# Altium schematic sheet Power4HiSpeed.SchDoc
size A3; Organization: Altium Limited; Address1: L3, 12a Rodborough Rd; Address2: Frenchs Forest; Address3: NSW; Address4: Australia 2086
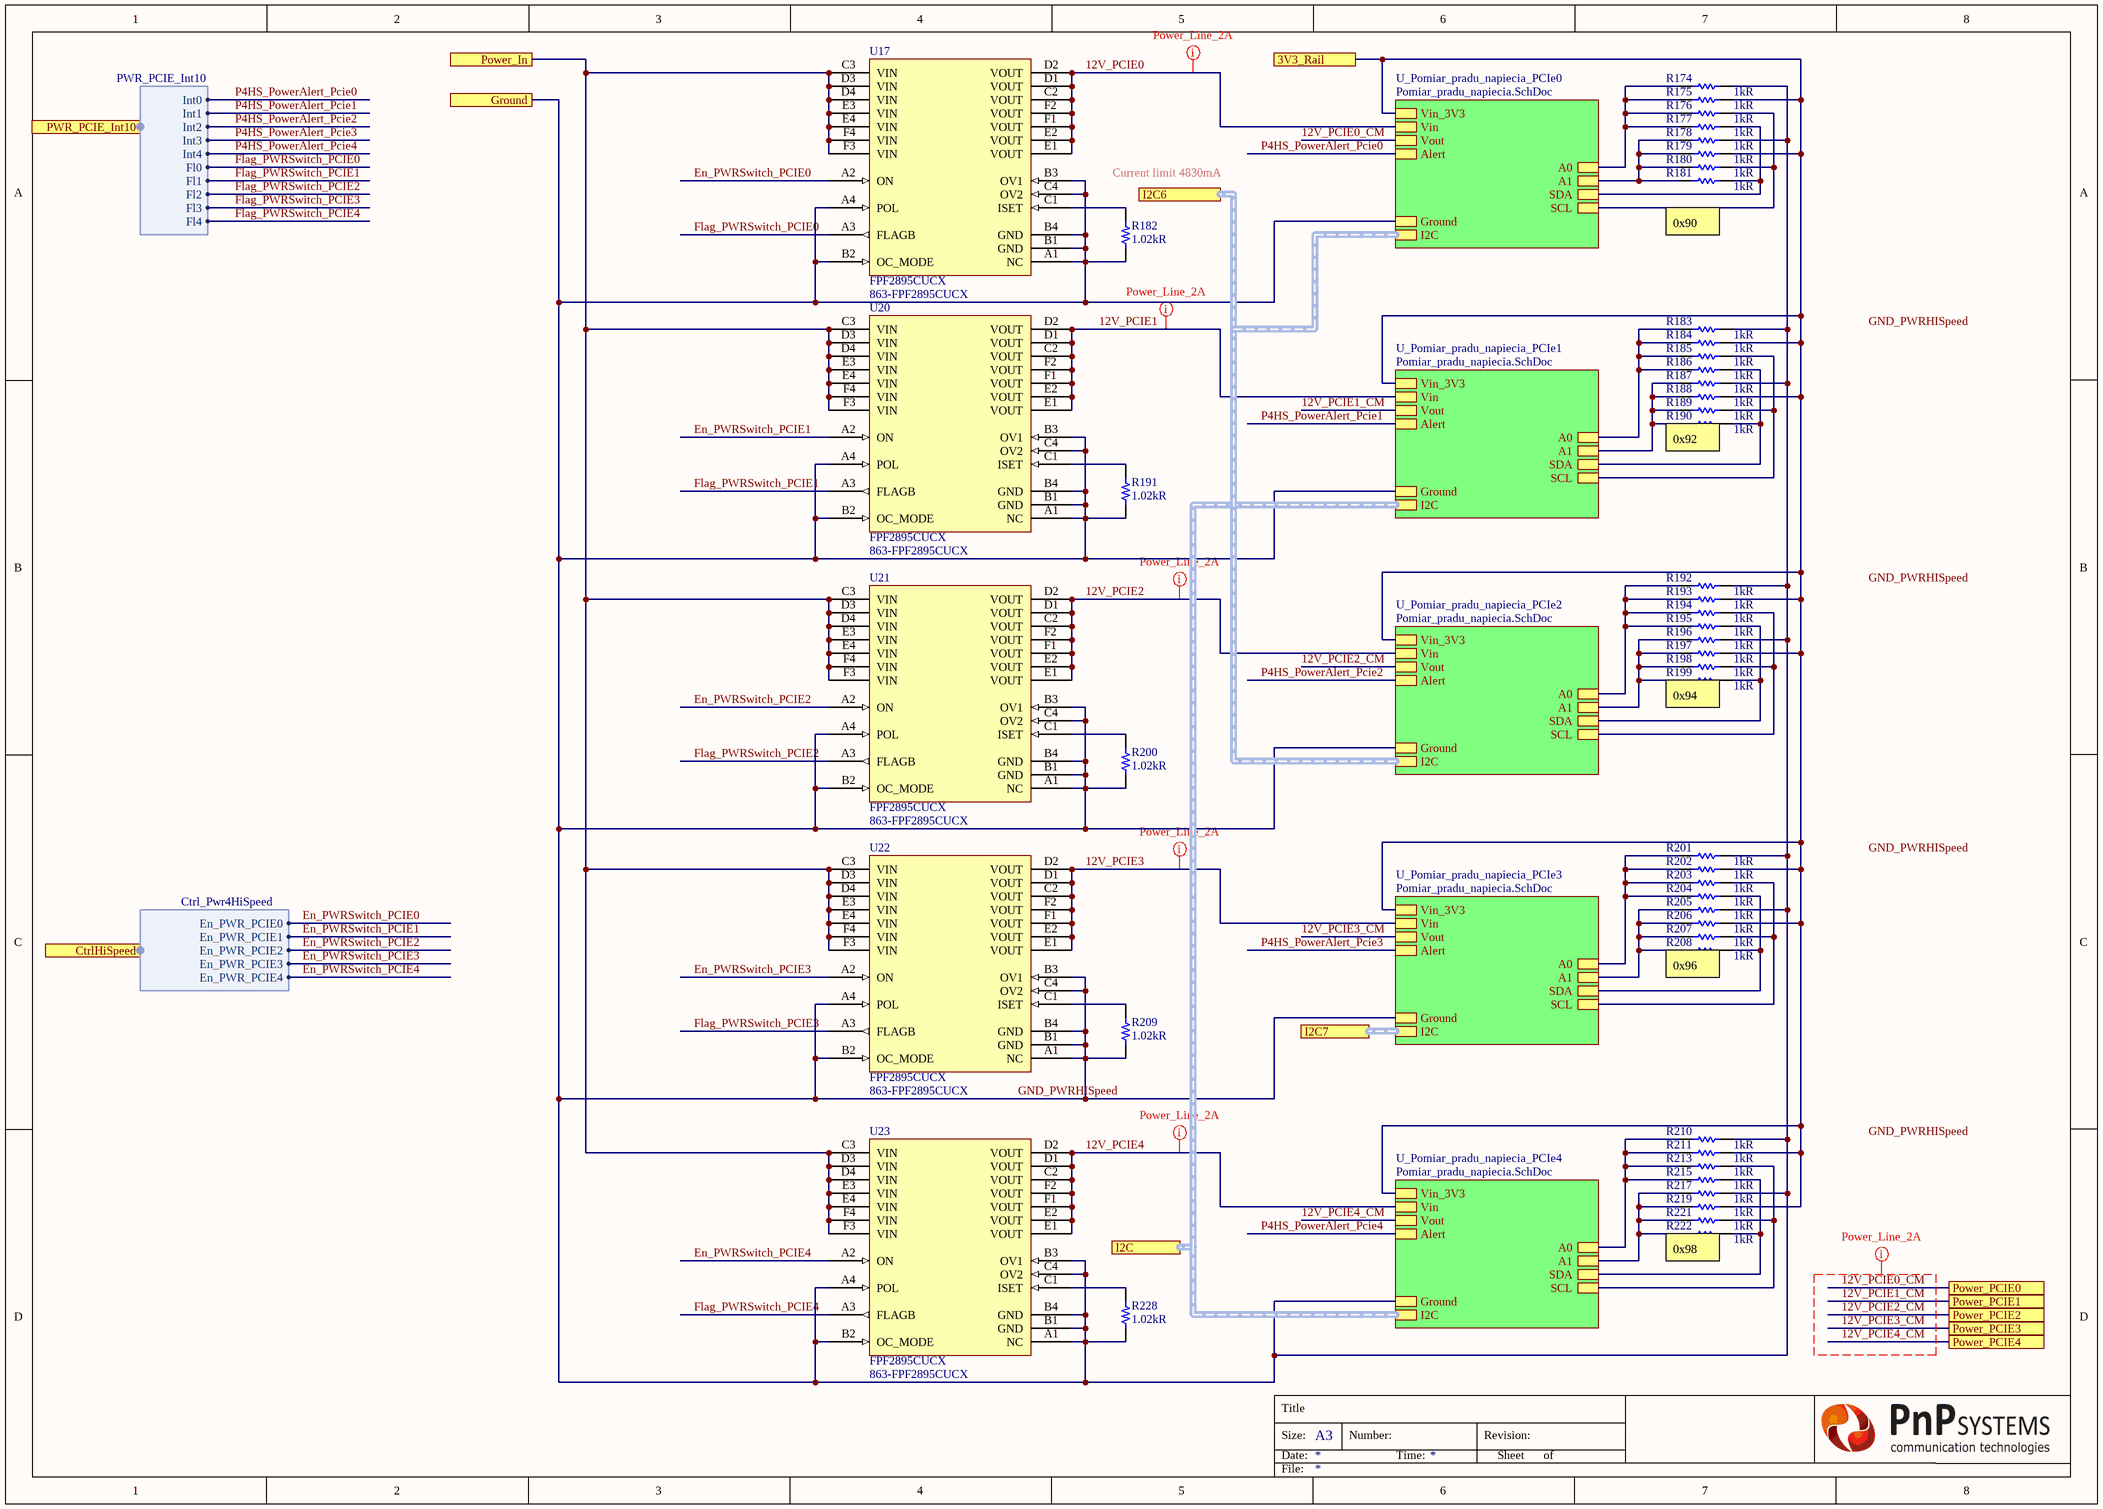
[diagram p0: Power4HiSpeed.SchDoc]

## Parts
R174  1kR  [RES 0402/1005 RF KK]
R175  1kR  [RES 0402/1005 RF KK]
R176  1kR  [RES 0402/1005 RF KK]
R177  1kR  [RES 0402/1005 RF KK]
R178  1kR  [RES 0402/1005 RF KK]
R179  1kR  [RES 0402/1005 RF KK]
R180  1kR  [RES 0402/1005 RF KK]
R181  1kR  [RES 0402/1005 RF KK]
R182  1.02kR  [RES 0402/1005 RF KK]
R183  1kR  [RES 0402/1005 RF KK]
R184  1kR  [RES 0402/1005 RF KK]
R185  1kR  [RES 0402/1005 RF KK]
R186  1kR  [RES 0402/1005 RF KK]
R187  1kR  [RES 0402/1005 RF KK]
R188  1kR  [RES 0402/1005 RF KK]
R189  1kR  [RES 0402/1005 RF KK]
R190  1kR  [RES 0402/1005 RF KK]
R191  1.02kR  [RES 0402/1005 RF KK]
R192  1kR  [RES 0402/1005 RF KK]
R193  1kR  [RES 0402/1005 RF KK]
R194  1kR  [RES 0402/1005 RF KK]
R195  1kR  [RES 0402/1005 RF KK]
R196  1kR  [RES 0402/1005 RF KK]
R197  1kR  [RES 0402/1005 RF KK]
R198  1kR  [RES 0402/1005 RF KK]
R199  1kR  [RES 0402/1005 RF KK]
R200  1.02kR  [RES 0402/1005 RF KK]
R201  1kR  [RES 0402/1005 RF KK]
R202  1kR  [RES 0402/1005 RF KK]
R203  1kR  [RES 0402/1005 RF KK]
R204  1kR  [RES 0402/1005 RF KK]
R205  1kR  [RES 0402/1005 RF KK]
R206  1kR  [RES 0402/1005 RF KK]
R207  1kR  [RES 0402/1005 RF KK]
R208  1kR  [RES 0402/1005 RF KK]
R209  1.02kR  [RES 0402/1005 RF KK]
R210  1kR  [RES 0402/1005 RF KK]
R211  1kR  [RES 0402/1005 RF KK]
R213  1kR  [RES 0402/1005 RF KK]
R215  1kR  [RES 0402/1005 RF KK]
R217  1kR  [RES 0402/1005 RF KK]
R219  1kR  [RES 0402/1005 RF KK]
R221  1kR  [RES 0402/1005 RF KK]
R222  1kR  [RES 0402/1005 RF KK]
R228  1.02kR  [RES 0402/1005 RF KK]
U17  FPF2895CUCX  Supplier Part Number 1: 863-FPF2895CUCX  [FPF2895C-D]
U20  FPF2895CUCX  Supplier Part Number 1: 863-FPF2895CUCX  [FPF2895C-D]
U21  FPF2895CUCX  Supplier Part Number 1: 863-FPF2895CUCX  [FPF2895C-D]
U22  FPF2895CUCX  Supplier Part Number 1: 863-FPF2895CUCX  [FPF2895C-D]
U23  FPF2895CUCX  Supplier Part Number 1: 863-FPF2895CUCX  [FPF2895C-D]

## Sub-sheets
U_Pomiar_pradu_napiecia_PCIe0 = Pomiar_pradu_napiecia.SchDoc: Vin_3V3, Vin, Vout, Alert, A0, A1, SDA, SCL, Ground, I2C (harness I2C)
U_Pomiar_pradu_napiecia_PCIe1 = Pomiar_pradu_napiecia.SchDoc: Vin_3V3, Vin, Vout, Alert, A0, A1, SDA, SCL, Ground, I2C (harness I2C)
U_Pomiar_pradu_napiecia_PCIe2 = Pomiar_pradu_napiecia.SchDoc: Vin_3V3, Vin, Vout, Alert, A0, A1, SDA, SCL, Ground, I2C (harness I2C)
U_Pomiar_pradu_napiecia_PCIe3 = Pomiar_pradu_napiecia.SchDoc: Vin_3V3, Vin, Vout, Alert, A0, A1, SDA, SCL, Ground, I2C (harness I2C)
U_Pomiar_pradu_napiecia_PCIe4 = Pomiar_pradu_napiecia.SchDoc: Vin_3V3, Vin, Vout, Alert, A0, A1, SDA, SCL, Ground, I2C (harness I2C)

## Ports
3V3_Rail, CtrlHiSpeed (harness Ctrl_Pwr4HiSpeed), Ground, I2C6, I2C7, I2C (harness I2C), Power_In, Power_PCIE0, Power_PCIE1, Power_PCIE2, Power_PCIE3, Power_PCIE4, PWR_PCIE_Int10 (harness PWR_PCIE_Int10)

## Harnesses
Ctrl_Pwr4HiSpeed: En_PWR_PCIE0, En_PWR_PCIE1, En_PWR_PCIE2, En_PWR_PCIE3, En_PWR_PCIE4
PWR_PCIE_Int10: Int0, Int1, Int2, Int3, Int4, Fl0, Fl1, Fl2, Fl3, Fl4

## Nets
3V3_Rail: R175.2 R179.2 R184.2 R188.2 R193.2 R197.2 R202.2 R206.2 R211.2 R219.2 ; port 3V3_Rail, sheet U_Pomiar_pradu_napiecia_PCIe0/Vin_3V3, sheet U_Pomiar_pradu_napiecia_PCIe1/Vin_3V3, sheet U_Pomiar_pradu_napiecia_PCIe2/Vin_3V3, sheet U_Pomiar_pradu_napiecia_PCIe3/Vin_3V3, sheet U_Pomiar_pradu_napiecia_PCIe4/Vin_3V3
12V_PCIE0: U17.C2(VOUT) U17.D1(VOUT) U17.D2(VOUT) U17.E1(VOUT) U17.E2(VOUT) U17.F1(VOUT) U17.F2(VOUT) ; sheet U_Pomiar_pradu_napiecia_PCIe0/Vin
12V_PCIE0_CM: port Power_PCIE0, sheet U_Pomiar_pradu_napiecia_PCIe0/Vout
12V_PCIE1: U20.C2(VOUT) U20.D1(VOUT) U20.D2(VOUT) U20.E1(VOUT) U20.E2(VOUT) U20.F1(VOUT) U20.F2(VOUT) ; sheet U_Pomiar_pradu_napiecia_PCIe1/Vin
12V_PCIE1_CM: port Power_PCIE1, sheet U_Pomiar_pradu_napiecia_PCIe1/Vout
12V_PCIE2: U21.C2(VOUT) U21.D1(VOUT) U21.D2(VOUT) U21.E1(VOUT) U21.E2(VOUT) U21.F1(VOUT) U21.F2(VOUT) ; sheet U_Pomiar_pradu_napiecia_PCIe2/Vin
12V_PCIE2_CM: port Power_PCIE2, sheet U_Pomiar_pradu_napiecia_PCIe2/Vout
12V_PCIE3: U22.C2(VOUT) U22.D1(VOUT) U22.D2(VOUT) U22.E1(VOUT) U22.E2(VOUT) U22.F1(VOUT) U22.F2(VOUT) ; sheet U_Pomiar_pradu_napiecia_PCIe3/Vin
12V_PCIE3_CM: port Power_PCIE3, sheet U_Pomiar_pradu_napiecia_PCIe3/Vout
12V_PCIE4: U23.C2(VOUT) U23.D1(VOUT) U23.D2(VOUT) U23.E1(VOUT) U23.E2(VOUT) U23.F1(VOUT) U23.F2(VOUT) ; sheet U_Pomiar_pradu_napiecia_PCIe4/Vin
12V_PCIE4_CM: port Power_PCIE4, sheet U_Pomiar_pradu_napiecia_PCIe4/Vout
En_PWRSwitch_PCIE0: U17.A2(ON) ; port CtrlHiSpeed.En_PWR_PCIE0
En_PWRSwitch_PCIE1: U20.A2(ON) ; port CtrlHiSpeed.En_PWR_PCIE1
En_PWRSwitch_PCIE2: U21.A2(ON) ; port CtrlHiSpeed.En_PWR_PCIE2
En_PWRSwitch_PCIE3: U22.A2(ON) ; port CtrlHiSpeed.En_PWR_PCIE3
En_PWRSwitch_PCIE4: U23.A2(ON) ; port CtrlHiSpeed.En_PWR_PCIE4
Flag_PWRSwitch_PCIE0: U17.A3(FLAGB) ; port PWR_PCIE_Int10.Fl0
Flag_PWRSwitch_PCIE1: U20.A3(FLAGB) ; port PWR_PCIE_Int10.Fl1
Flag_PWRSwitch_PCIE2: U21.A3(FLAGB) ; port PWR_PCIE_Int10.Fl2
Flag_PWRSwitch_PCIE3: U22.A3(FLAGB) ; port PWR_PCIE_Int10.Fl3
Flag_PWRSwitch_PCIE4: U23.A3(FLAGB) ; port PWR_PCIE_Int10.Fl4
GND_PWRHISpeed: R174.2 R178.2 R182.1 R183.2 R187.2 R191.1 R192.2 R196.2 R200.1 R201.2 R205.2 R209.1 R210.2 R217.2 R228.1 U17.A1(NC) U17.A4(POL) U17.B1(GND) U17.B2(OC_MODE) U17.B3(OV1) U17.B4(GND) U17.C4(OV2) U20.A1(NC) U20.A4(POL) U20.B1(GND) U20.B2(OC_MODE) U20.B3(OV1) U20.B4(GND) U20.C4(OV2) U21.A1(NC) U21.A4(POL) U21.B1(GND) U21.B2(OC_MODE) U21.B3(OV1) U21.B4(GND) U21.C4(OV2) U22.A1(NC) U22.A4(POL) U22.B1(GND) U22.B2(OC_MODE) U22.B3(OV1) U22.B4(GND) U22.C4(OV2) U23.A1(NC) U23.A4(POL) U23.B1(GND) U23.B2(OC_MODE) U23.B3(OV1) U23.B4(GND) U23.C4(OV2) ; port Ground, sheet U_Pomiar_pradu_napiecia_PCIe0/Ground, sheet U_Pomiar_pradu_napiecia_PCIe1/Ground, sheet U_Pomiar_pradu_napiecia_PCIe2/Ground, sheet U_Pomiar_pradu_napiecia_PCIe3/Ground, sheet U_Pomiar_pradu_napiecia_PCIe4/Ground
P4HS_PowerAlert_Pcie0: sheet U_Pomiar_pradu_napiecia_PCIe0/Alert, port PWR_PCIE_Int10.Int0
P4HS_PowerAlert_Pcie1: sheet U_Pomiar_pradu_napiecia_PCIe1/Alert, port PWR_PCIE_Int10.Int1
P4HS_PowerAlert_Pcie2: sheet U_Pomiar_pradu_napiecia_PCIe2/Alert, port PWR_PCIE_Int10.Int2
P4HS_PowerAlert_Pcie3: sheet U_Pomiar_pradu_napiecia_PCIe3/Alert, port PWR_PCIE_Int10.Int3
P4HS_PowerAlert_Pcie4: sheet U_Pomiar_pradu_napiecia_PCIe4/Alert, port PWR_PCIE_Int10.Int4
Power_In: U17.C3(VIN) U17.D3(VIN) U17.D4(VIN) U17.E3(VIN) U17.E4(VIN) U17.F3(VIN) U17.F4(VIN) U20.C3(VIN) U20.D3(VIN) U20.D4(VIN) U20.E3(VIN) U20.E4(VIN) U20.F3(VIN) U20.F4(VIN) U21.C3(VIN) U21.D3(VIN) U21.D4(VIN) U21.E3(VIN) U21.E4(VIN) U21.F3(VIN) U21.F4(VIN) U22.C3(VIN) U22.D3(VIN) U22.D4(VIN) U22.E3(VIN) U22.E4(VIN) U22.F3(VIN) U22.F4(VIN) U23.C3(VIN) U23.D3(VIN) U23.D4(VIN) U23.E3(VIN) U23.E4(VIN) U23.F3(VIN) U23.F4(VIN) ; port Power_In
NetR174_1: R174.1 R175.1 R176.1 R177.1 ; sheet U_Pomiar_pradu_napiecia_PCIe0/A0
NetR176_2: R176.2 R180.2 ; sheet U_Pomiar_pradu_napiecia_PCIe0/SCL
NetR177_2: R177.2 R181.2 ; sheet U_Pomiar_pradu_napiecia_PCIe0/SDA
NetR178_1: R178.1 R179.1 R180.1 R181.1 ; sheet U_Pomiar_pradu_napiecia_PCIe0/A1
NetR182_2: R182.2 U17.C1(ISET)
NetR183_1: R183.1 R184.1 R185.1 R186.1 ; sheet U_Pomiar_pradu_napiecia_PCIe1/A0
NetR185_2: R185.2 R189.2 ; sheet U_Pomiar_pradu_napiecia_PCIe1/SCL
NetR186_2: R186.2 R190.2 ; sheet U_Pomiar_pradu_napiecia_PCIe1/SDA
NetR187_1: R187.1 R188.1 R189.1 R190.1 ; sheet U_Pomiar_pradu_napiecia_PCIe1/A1
NetR191_2: R191.2 U20.C1(ISET)
NetR192_1: R192.1 R193.1 R194.1 R195.1 ; sheet U_Pomiar_pradu_napiecia_PCIe2/A0
NetR194_2: R194.2 R198.2 ; sheet U_Pomiar_pradu_napiecia_PCIe2/SCL
NetR195_2: R195.2 R199.2 ; sheet U_Pomiar_pradu_napiecia_PCIe2/SDA
NetR196_1: R196.1 R197.1 R198.1 R199.1 ; sheet U_Pomiar_pradu_napiecia_PCIe2/A1
NetR200_2: R200.2 U21.C1(ISET)
NetR201_1: R201.1 R202.1 R203.1 R204.1 ; sheet U_Pomiar_pradu_napiecia_PCIe3/A0
NetR203_2: R203.2 R207.2 ; sheet U_Pomiar_pradu_napiecia_PCIe3/SCL
NetR204_2: R204.2 R208.2 ; sheet U_Pomiar_pradu_napiecia_PCIe3/SDA
NetR205_1: R205.1 R206.1 R207.1 R208.1 ; sheet U_Pomiar_pradu_napiecia_PCIe3/A1
NetR209_2: R209.2 U22.C1(ISET)
NetR210_1: R210.1 R211.1 R213.1 R215.1 ; sheet U_Pomiar_pradu_napiecia_PCIe4/A0
NetR213_2: R213.2 R221.2 ; sheet U_Pomiar_pradu_napiecia_PCIe4/SCL
NetR215_2: R215.2 R222.2 ; sheet U_Pomiar_pradu_napiecia_PCIe4/SDA
NetR217_1: R217.1 R219.1 R221.1 R222.1 ; sheet U_Pomiar_pradu_napiecia_PCIe4/A1
NetR228_2: R228.2 U23.C1(ISET)

## Buses and harness runs
harness port I2C6 = sheet U_Pomiar_pradu_napiecia_PCIe0/I2C = sheet U_Pomiar_pradu_napiecia_PCIe2/I2C
harness port I2C7 = sheet U_Pomiar_pradu_napiecia_PCIe3/I2C
harness port I2C = sheet U_Pomiar_pradu_napiecia_PCIe1/I2C = sheet U_Pomiar_pradu_napiecia_PCIe4/I2C

## Layout directives
net class Power_Line_2A: 12V_PCIE0, 12V_PCIE0_CM, 12V_PCIE1, 12V_PCIE1_CM, 12V_PCIE2, 12V_PCIE2_CM, 12V_PCIE3, 12V_PCIE3_CM, 12V_PCIE4, 12V_PCIE4_CM

## Notes on the sheet
- (near R182) Current limit 4830mA
- 0x90
- (near R190) 0x92
- (near R199) 0x94
- (near R208) 0x96
- (near R222) 0x98
- Labels drawn without touching a wire or pin: GND_PWRHISpeed
- Title
- Size:
- Date:
- A3
- Number:
- Time:
- Revision:
- Sheet
- of
- File:

## Library data of the parts
R174-R181 R183-R190 R192-R199 R201-R208 R210 R211 R213 R215 R217 R219 R221 R222 = Resistor: PANASONIC - ERJ-2RKF1001X - SMD Chip Resistor, 0402 [1005 Metric], 1 kohm, ERJ2R Series, 50 V, Thick Film, 100 mW; Voltage Rating (DC): 50V; Temperature Coefficient: 100ppm/°C; Tolerance: 1%; Power Rating: 100mW; Supplier 1: Digi-Key; Supplier Part Number 1: P1.00KLDKR-ND; Manufacturer: Panasonic; Manufacturer Part Number: ERJ-2RKF1001X; RoHS: Yes; Category: Chip SMD Resistors; Stock 1: 1864188; Pricing 1: 1=0,10000, 10=0,04300, 100=0,01740, 1000=0,00782, 2500=0,00678, 5000=0,00561 (USD); Mount: Surface Mount; Case/Package: 0402; Number of Pins: 2; Case Code (Imperial): 0402; Case Code (Metric): 1005; Contact Plating: Tin; Min Operating Temperature: -55°C; Max Operating Temperature: 155°C; Termination: SMD/SMT; Composition: Thick Film; Number of Terminations: 2; Military Standard: Not; Features: Automotive AEC-Q200; Resistance: 1kR; Packaging: Tape and Reel; Voltage Rating: 50V; Package Quantity: 1; Max Power Dissipation: 100mW; Working Voltage: 50V; Length: 1mm; Height: 0.35mm; Depth: 0.5mm; Width: 0.5mm; Radiation Hardening: No; Lead Free: Lead Free; REACH SVHC: No SVHC; ComponentLink1URL: https://datasheet.ciiva.com/11821/0900766b80f80784-11821203.pdf?src-supplier=RSComponents; ComponentLink1Description: https://datasheet.ciiva.com/11821/0900766b80f80784-11821203.pdf?src-supplier=RSComponents; ComponentLink2URL: https://datasheet.ciiva.com/7942/aoa0000ce2-7942426.pdf?src-supplier=Element14; ComponentLink2Description: https://datasheet.ciiva.com/7942/aoa0000ce2-7942426.pdf?src-supplier=Element14; ComponentLink3URL: https://datasheet.ciiva.com/16523/aoa0000ce2-16523834.pdf?src-supplier=Avnet+Asia; ComponentLink3Description: https://datasheet.ciiva.com/16523/aoa0000ce2-16523834.pdf?src-supplier=Avnet+Asia; ComponentLink4URL: https://datasheet.ciiva.com/17215/aoa0000ce2-17215308.pdf?src-supplier=Avnet+Europe; ComponentLink4Description: https://datasheet.ciiva.com/17215/aoa0000ce2-17215308.pdf?src-supplier=Avnet+Europe; ComponentLink5URL: https://datasheet.ciiva.com/22673/1678782-22673916.pdf?src-supplier=Element14; ComponentLink5Description: https://datasheet.ciiva.com/22673/1678782-22673916.pdf?src-supplier=Element14; ComponentLink6URL: https://datasheet.ciiva.com/28532/1678782-28532109.pdf?src-supplier=Element14; ComponentLink6Description: https://datasheet.ciiva.com/28532/1678782-28532109.pdf?src-supplier=Element14; ComponentLink7URL: https://datasheet.ciiva.com/16767/70260748-16767559.pdf?src-supplier=Allied+Electronics; ComponentLink7Description: https://datasheet.ciiva.com/16767/70260748-16767559.pdf?src-supplier=Allied+Electronics; ComponentLink8URL: https://datasheet.ciiva.com/9198/aoa0000ce2-9198920.pdf?src-supplier=Avnet; ComponentLink8Description: https://datasheet.ciiva.com/9198/aoa0000ce2-9198920.pdf?src-supplier=Avnet; ComponentLink9URL: https://datasheet.ciiva.com/16771/70260748-16771979.pdf?src-supplier=Allied+Electronics; ComponentLink9Description: https://datasheet.ciiva.com/16771/70260748-16771979.pdf?src-supplier=Allied+Electronics
R182 R191 R200 R209 R228 = Resistor: Manufacturer: Panasonic; Manufacturer Part Number: ERJ-2RKF1021X; Tolerance: 1%; Temperature Coefficient: 100ppm/°C; Power Rating: 100mW; Voltage Rating: 50V; Supplier 1: Digi-Key; Supplier Part Number 1: P1.02KLCT-ND; Stock 1: 88589; Pricing 1: 1 = 0,10000, 10 = 0,04300, 100 = 0,01750, 1000 = 0,00787, 2500 = 0,00683, 5000 = 0,00564 (USD); RoHS: Yes; Mount: Surface Mount; Case/Package: 0402; Case Code (Metric): 1005; Case Code (Imperial): 0402; Contact Plating: Tin; Min Operating Temperature: -55°C; Max Operating Temperature: 155°C; Resistance: 1.02kR; Packaging: Tape and Reel; Composition: Thick Film; Number of Terminations: 2; Voltage Rating (DC): 50V; Max Power Dissipation: 100mW; Features: Automotive AEC-Q200; Package Quantity: 1; Termination: SMD/SMT; Military Standard: Not; Length: 1mm; Height: 0.35mm; Width: 0.02inch; Depth: 0.5mm; REACH SVHC: No SVHC; Lead Free: Lead Free; ComponentLink1URL: https://datasheet.ciiva.com/16760/70260748-16760677.pdf?src-supplier=Allied+Electronics; ComponentLink1Description: https://datasheet.ciiva.com/16760/70260748-16760677.pdf?src-supplier=Allied+Electronics; ComponentLink2URL: https://datasheet.ciiva.com/24026/aoa0000ce2-24026598.pdf?src-supplier=Mouser; ComponentLink2Description: https://datasheet.ciiva.com/24026/aoa0000ce2-24026598.pdf?src-supplier=Mouser; ComponentLink3URL: https://datasheet.ciiva.com/22743/1678782-22743480.pdf?src-supplier=Farnell; ComponentLink3Description: https://datasheet.ciiva.com/22743/1678782-22743480.pdf?src-supplier=Farnell; ComponentLink4URL: https://datasheet.ciiva.com/16778/70260748-16778748.pdf?src-supplier=Allied+Electronics; ComponentLink4Description: https://datasheet.ciiva.com/16778/70260748-16778748.pdf?src-supplier=Allied+Electronics; ComponentLink5URL: https://datasheet.ciiva.com/22682/1678782-22682413.pdf?src-supplier=Element14; ComponentLink5Description: https://datasheet.ciiva.com/22682/1678782-22682413.pdf?src-supplier=Element14; ComponentLink6URL: https://datasheet.ciiva.com/46373/1678782-46373838.pdf?src-supplier=Element14; ComponentLink6Description: https://datasheet.ciiva.com/46373/1678782-46373838.pdf?src-supplier=Element14; ComponentLink7URL: https://datasheet.ciiva.com/46373/1678782-46373839.pdf?src-supplier=Element14; ComponentLink7Description: https://datasheet.ciiva.com/46373/1678782-46373839.pdf?src-supplier=Element14
U17 U20-U23 = FPF2895CUCX: Current Limit Load Switch with OVP and TRCB, 28 V, 5 A; Manufacturer 1: ON Semiconductor; Supplier 1: Mouser; Manufacturer Part Number 1: FPF2895CUCX; Stock 1: 808; Pricing 1: 1=2,18000, 10=1,85000, 100=1,48000, 500=1,29000, 1000=1,07000, 3000=1,00000, 6000=0,96500, 9000=0,92800, 24000=0,89200 (USD); RoHS: No